# Altium schematic sheet PogonDesneNoge.SchDoc
size A4; SheetNumber: 4; SheetTotal: 4
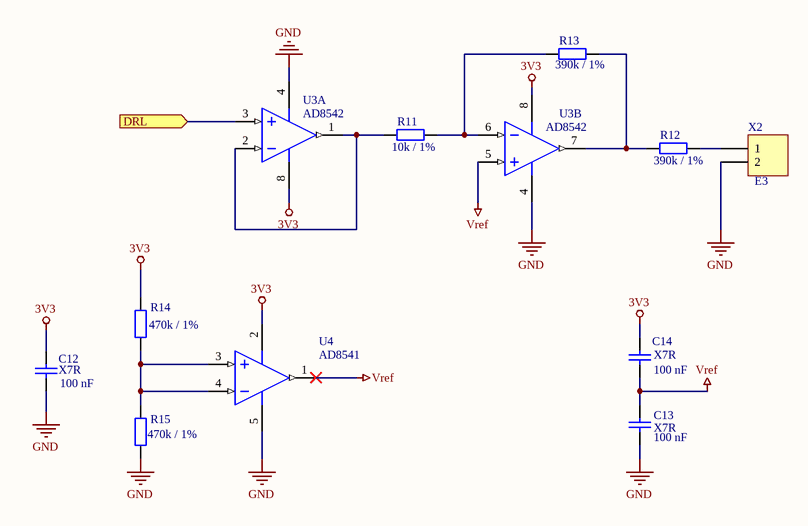
[diagram p0: PogonDesneNoge.SchDoc]

## Parts
C12  X7R  value 100 nF  [C0805]
C13  X7R  value 100 nF  [C0805]
C14  X7R  value 100 nF  [C0805]
R11  10k / 1%  [6-0805_N]
R12  390k / 1%  [6-0805_N]
R13  390k / 1%  [6-0805_N]
R14  470k / 1%  [6-0805_N]
R15  470k / 1%  [6-0805_N]
U3  AD8542  [ADI-R-8_M]  (parts A,B of 2)
U4  AD8541  [ADI-RJ-5_N]
X2  Header 2  [HDR1X2]  (value not drawn)

## Ports
DRL (in, see Top[3B], Instr_pojacalo[3D])

## Nets
3V3: C12.2 C14.2 R14.2 U3.8(+V) U4.2(-V)
GND: C12.1 C13.1 R15.1 U3.4(-V) U4.5(+V) X2.2
Vref: C13.2 C14.1 U3.5(+IN_B) U4.1(OUT_A)
DRL: U3.3(+IN_A) ; port DRL
NetR11_1: R11.1 R13.1 U3.6(-IN_B)
NetR11_2: R11.2 U3.1(OUT_A) U3.2(-IN_A)
NetR12_1: R12.1 X2.1
NetR12_2: R12.2 R13.2 U3.7(OUT_B)
NetR14_1: R14.1 R15.2 U4.3(+IN_A) U4.4(-IN_A)

## Notes on the sheet
- (near X2) E3

## Library data of the parts
C12-C14 = Cap: Capacitor; Proizvođač: Murata Electronics; Kataloški broj: GCM21BR71H104KA37L; Cijena: 0,28 €; Kućište: 0805; Opis: Keramički kondenzator, 100 nF, 50V, X7R
R11 = Res2: Resistor; Proizvođač: Vishay; Kataloški broj: CRCW080510K0FKEA; Cijena: 0,09 €; Kućište: 0805; Opis: Otpornik, 10 k, 1%; Value: 10k / 1%
R12 R13 = Res2: Resistor; Proizvođač: Vishay; Kataloški broj: CRCW0805390KFKEA; Cijena: 0,09 €; Kućište: 0805; Opis: Otpornik, 390 k, 1%; Value: 390k / 1%
R14 R15 = Res2: Resistor; Proizvođač: Vishay; Kataloški broj: CRCW0805470KFKEA; Cijena: 0,09 €; Kućište: 0805; Opis: Otpornik, 470 k, 1%; Value: 470k / 1%
U3 = CMP-0384-00597-1: Double Channel RRIO Operational Amplifier, 1 MHz BW, 920 mV/us SR, Industrial, 8-pin SOIC (R-8), Tube; Proizvođač: Analog Devices; Kataloški broj: AD8542ARZ; Cijena: 1,31 €; Kućište: SOIC-8; Opis: Dvostruko operacijsko pojačalo
U4 = CMP-0384-01498-2: Single Channel RRIO Operational Amplifier, 1 MHz BW, 920 mV/us SR, Industrial, 5-pin SOT23 (RJ-5), Reel; Proizvođač: Analog Devices; Kataloški broj: AD8541ARTZ-REEL7; Cijena: 1,83 €; Kućište: SOT-23-5; Opis: Operacijsko pojačalo
X2 = CMP-002-00141-1: Header, 2-Pin; Signal Integrity: Connector; Proizvođač: Molex; Kataloški broj: 90120-0122; Cijena: 0,34 €; Kućište: THT Pin Header 2.54mm; Opis: Muški konektor 1x2, 2.54mm